# EAGLE design mbc_91_24_04_01 (EAGLE 7.6.0)

## Sheet 1 of 2
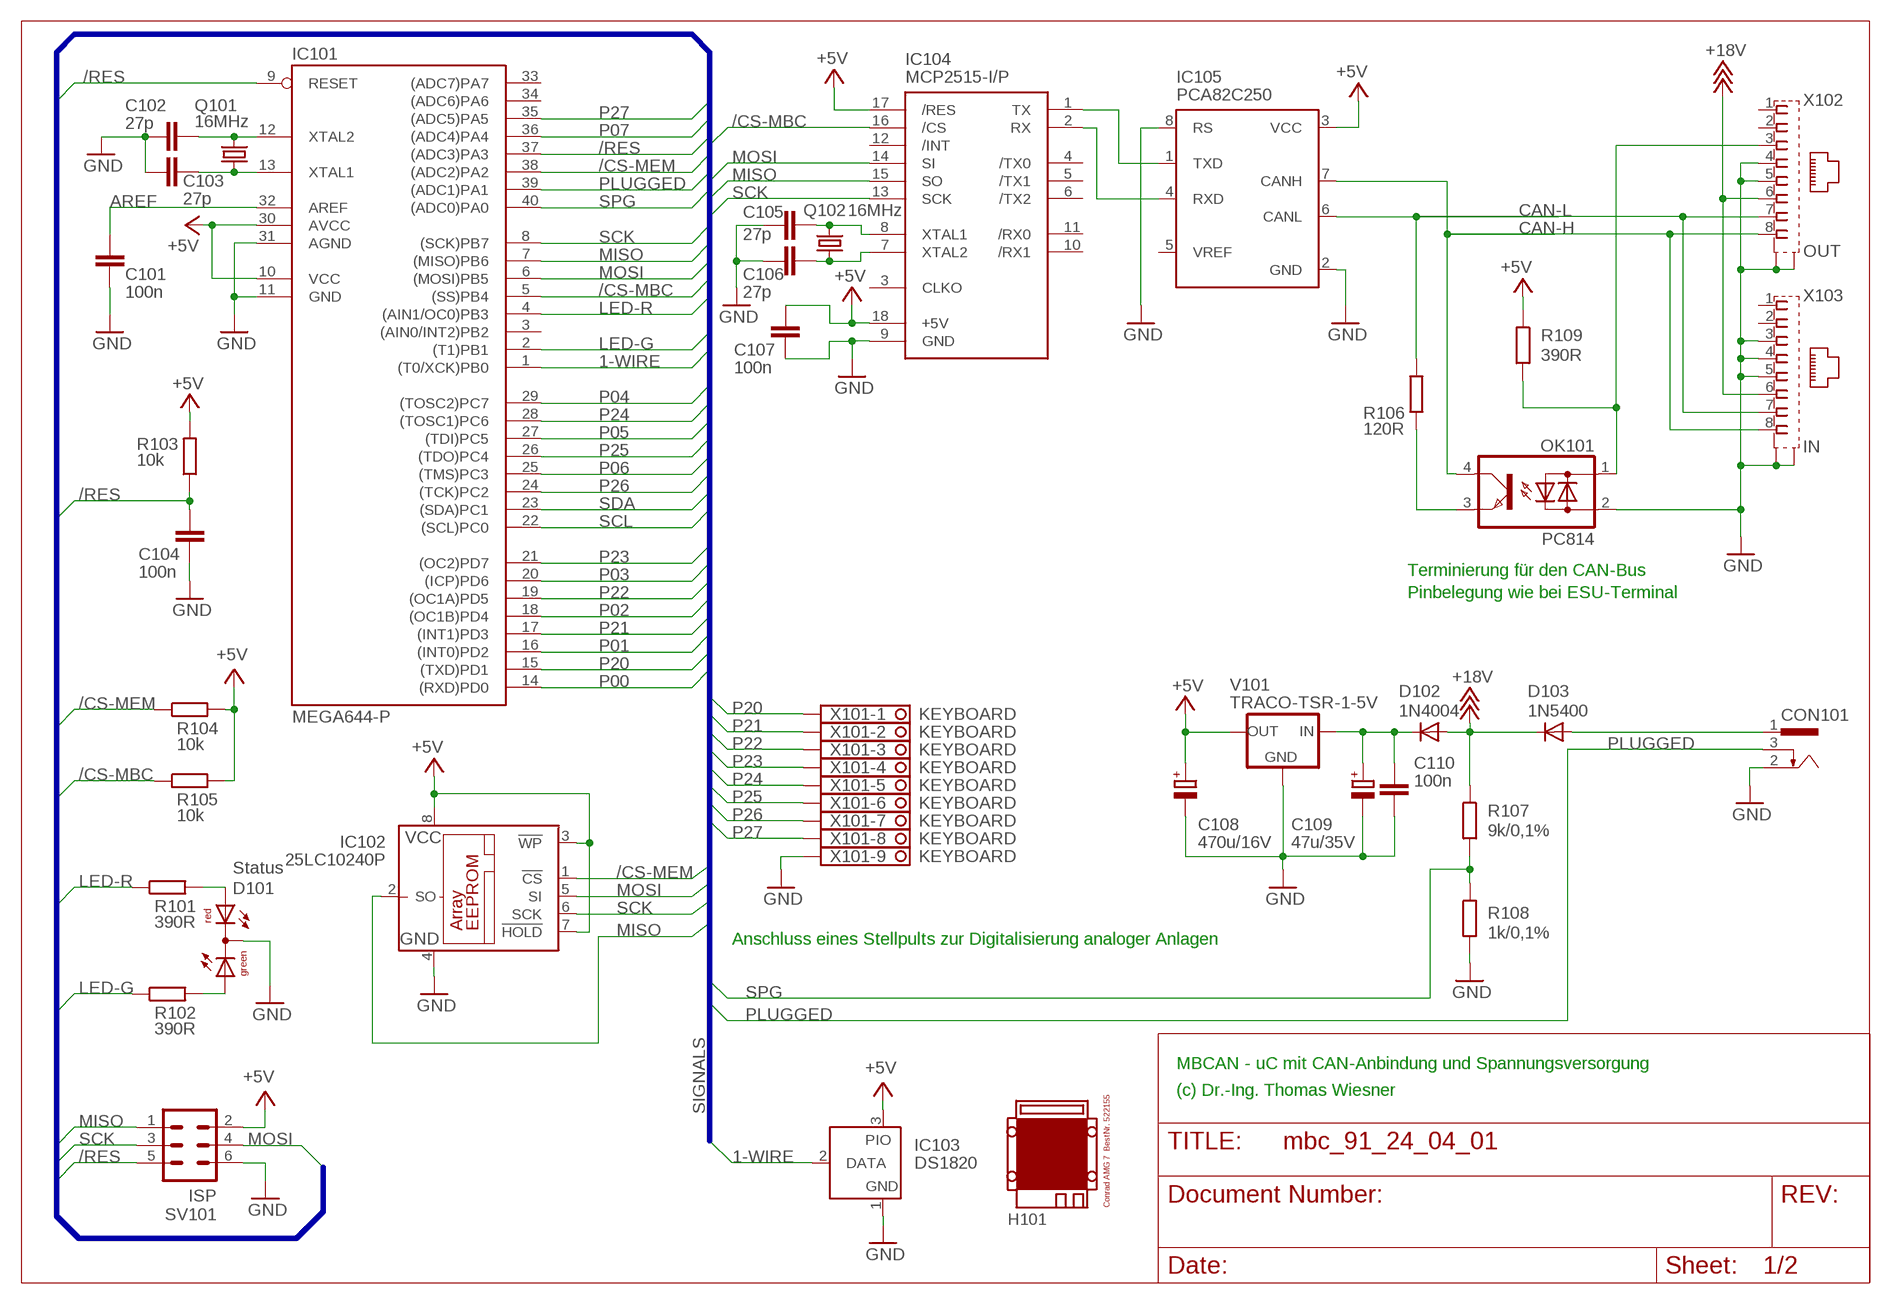
[diagram p0: schematic, sheet 1]

### Parts
C101  100n  C-EU025-025X050  [C025-025X050]
C102  27p  C-EU025-025X050  [C025-025X050]
C103  27p  C-EU025-025X050  [C025-025X050]
C104  100n  C-EU025-025X050  [C025-025X050]
C105  27p  C-EU025-025X050  [C025-025X050]
C106  27p  C-EU025-025X050  [C025-025X050]
C107  100n  C-EU025-025X050  [C025-025X050]
C108  470u/16V  CPOL-EUE3.5-8  [E3,5-8]
C109  47u/35V  CPOL-EUE2.5-7  [E2,5-7]
C110  100n  C-EU025-025X050  [C025-025X050]
CON101  POWER-JACK  [POWER-JACK]
D101  Status  DUOLED5MM  [DUOLED5MM]
D102  1N4004  [DO41-10]
D103  1N5400  [DO201-15]
H101  MODULGEHÄUSE-AMG-7  [MODULGEHÄUSE-AMG-7]
IC101  MEGA644-P  MEGA323-P  [DIL40]
IC102  25LC10240P  25LC040P  [DIL8]
IC103  DS1820  DS2405  [TO92-]
IC104  MCP2515-I/P  MCP2510-I/P  [DIL18]
IC105  PCA82C250  [DIL08]
OK101  PC814  [DIL04]
Q101  16MHz  CRYSTALHC49U70  [HC49U70]
Q102  16MHz  CRYSTALHC49U70  [HC49U70]
R101  390R  R-EU_0207/10  [0207/10]
R102  390R  R-EU_0207/10  [0207/10]
R103  10k  R-EU_0207/10  [0207/10]
R104  10k  R-EU_0207/10  [0207/10]
R105  10k  R-EU_0207/10  [0207/10]
R106  120R  R-EU_0207/10  [0207/10]
R107  9k/0,1%  R-EU_0207/10  [0207/10]
R108  1k/0,1%  R-EU_0207/10  [0207/10]
R109  390R  R-EU_0207/10  [0207/10]
SV101  ISP  ML6  [ML6]
V101  TRACO-TSR-1-5V  [TRACO-TSR-1]
X101  KEYBOARD  1751316  [1751316]
X102  OUT  0446200002  [0446200002]
X103  IN  0446200002  [0446200002]

### Nets
1-WIRE: IC101.1((T0/XCK)PB0) IC103.2(DATA)
+5V: C107.1 C108.+ IC101.10(VCC) IC101.30(AVCC) IC102.3(!WP) IC102.7(!HOLD) IC102.8(VCC) IC103.3(PIO) IC104.17(/RES) IC104.18(+5V) IC105.3(VCC) R103.2 R104.2 R105.2 R109.1 SV101.2 V101.OUT ; also sheet 2
+18V: D102.A D103.C R107.1 X102.6 X103.6 ; also sheet 2
/CS-MBC: IC101.5((SS)PB4) IC104.16(/CS) R105.1
/CS-MEM: IC101.38((ADC2)PA2) IC102.1(!CS) R104.1
/RES: C104.1 IC101.9(RESET) IC101.37((ADC3)PA3) R103.1 SV101.5
AREF: C101.1 IC101.32(AREF)
CAN-H: IC105.7(CANH) OK101.4(C) X102.8 X103.8
CAN-L: IC105.6(CANL) R106.2 X102.7 X103.7
GND: C101.2 C102.1 C103.1 C104.2 C105.1 C106.1 C107.2 C108.- C109.- C110.2 CON101.2 D101.K(C) IC101.11(GND) IC101.31(AGND) IC102.4(GND) IC103.1(GND) IC104.9(GND) IC105.2(GND) IC105.8(RS) OK101.2(AC2) R108.2 SV101.6 V101.GND X101.9 X102.4 X102.5 X102.S@1(S1) X102.S@2(S2) X103.3 X103.4 X103.5 X103.S@1(S1) X103.S@2(S2) ; also sheet 2
LED-G: IC101.2((T1)PB1) R102.1
LED-R: IC101.4((AIN1/OC0)PB3) R101.1
MISO: IC101.7((MISO)PB6) IC102.2(SO) IC104.15(SO) SV101.1
MOSI: IC101.6((MOSI)PB5) IC102.5(SI) IC104.14(SI) SV101.4
N$1: IC104.1(TX) IC105.1(TXD)
N$2: IC104.2(RX) IC105.4(RXD)
N$3: OK101.3(E) R106.1
N$4: OK101.1(AC1) R109.2 X102.3
N$6: C109.+ C110.1 D102.C V101.IN
N$9: D101.AR R101.2
N$13: D101.AG R102.2
N$21: C102.2 IC101.12(XTAL2) Q101.2
N$22: C103.2 IC101.13(XTAL1) Q101.1
N$23: C105.2 IC104.8(XTAL1) Q102.2
N$24: C106.2 IC104.7(XTAL2) Q102.1
P00: IC101.14((RXD)PD0) ; also sheet 2
P01: IC101.16((INT0)PD2) ; also sheet 2
P02: IC101.18((OC1B)PD4) ; also sheet 2
P03: IC101.20((ICP)PD6) ; also sheet 2
P04: IC101.29((TOSC2)PC7) ; also sheet 2
P05: IC101.27((TDI)PC5) ; also sheet 2
P06: IC101.25((TMS)PC3) ; also sheet 2
P07: IC101.36((ADC4)PA4) ; also sheet 2
P20: IC101.15((TXD)PD1) X101.1
P21: IC101.17((INT1)PD3) X101.2
P22: IC101.19((OC1A)PD5) X101.3
P23: IC101.21((OC2)PD7) X101.4
P24: IC101.28((TOSC1)PC6) X101.5
P25: IC101.26((TDO)PC4) X101.6
P26: IC101.24((TCK)PC2) X101.7
P27: IC101.35((ADC5)PA5) X101.8
PLUGGED: CON101.3 IC101.39((ADC1)PA1)
SCK: IC101.8((SCK)PB7) IC102.6(SCK) IC104.13(SCK) SV101.3
SCL: IC101.22((SCL)PC0) ; also sheet 2
SDA: IC101.23((SDA)PC1) ; also sheet 2
SPG: IC101.40((ADC0)PA0) R107.2 R108.1
V-NETZTEIL: CON101.1 D103.A
Unconnected: IC101.3((AIN0/INT2)PB2) IC101.33((ADC7)PA7) IC101.34((ADC6)PA6) IC104.3(CLKO) IC104.4(/TX0) IC104.5(/TX1) IC104.6(/TX2) IC104.10(/RX1) IC104.11(/RX0) IC104.12(/INT) IC105.5(VREF) X102.1 X102.2 X103.1 X103.2

### Buses
SIGNALS

### Notes on the sheet
- Terminierung für den CAN-Bus
- Pinbelegung wie bei ESU-Terminal
- Anschluss eines Stellpults zur Digitalisierung analoger Anlagen
- MBCAN - uC mit CAN-Anbindung und Spannungsversorgung
- (c) Dr.-Ing. Thomas Wiesner

## Sheet 2 of 2
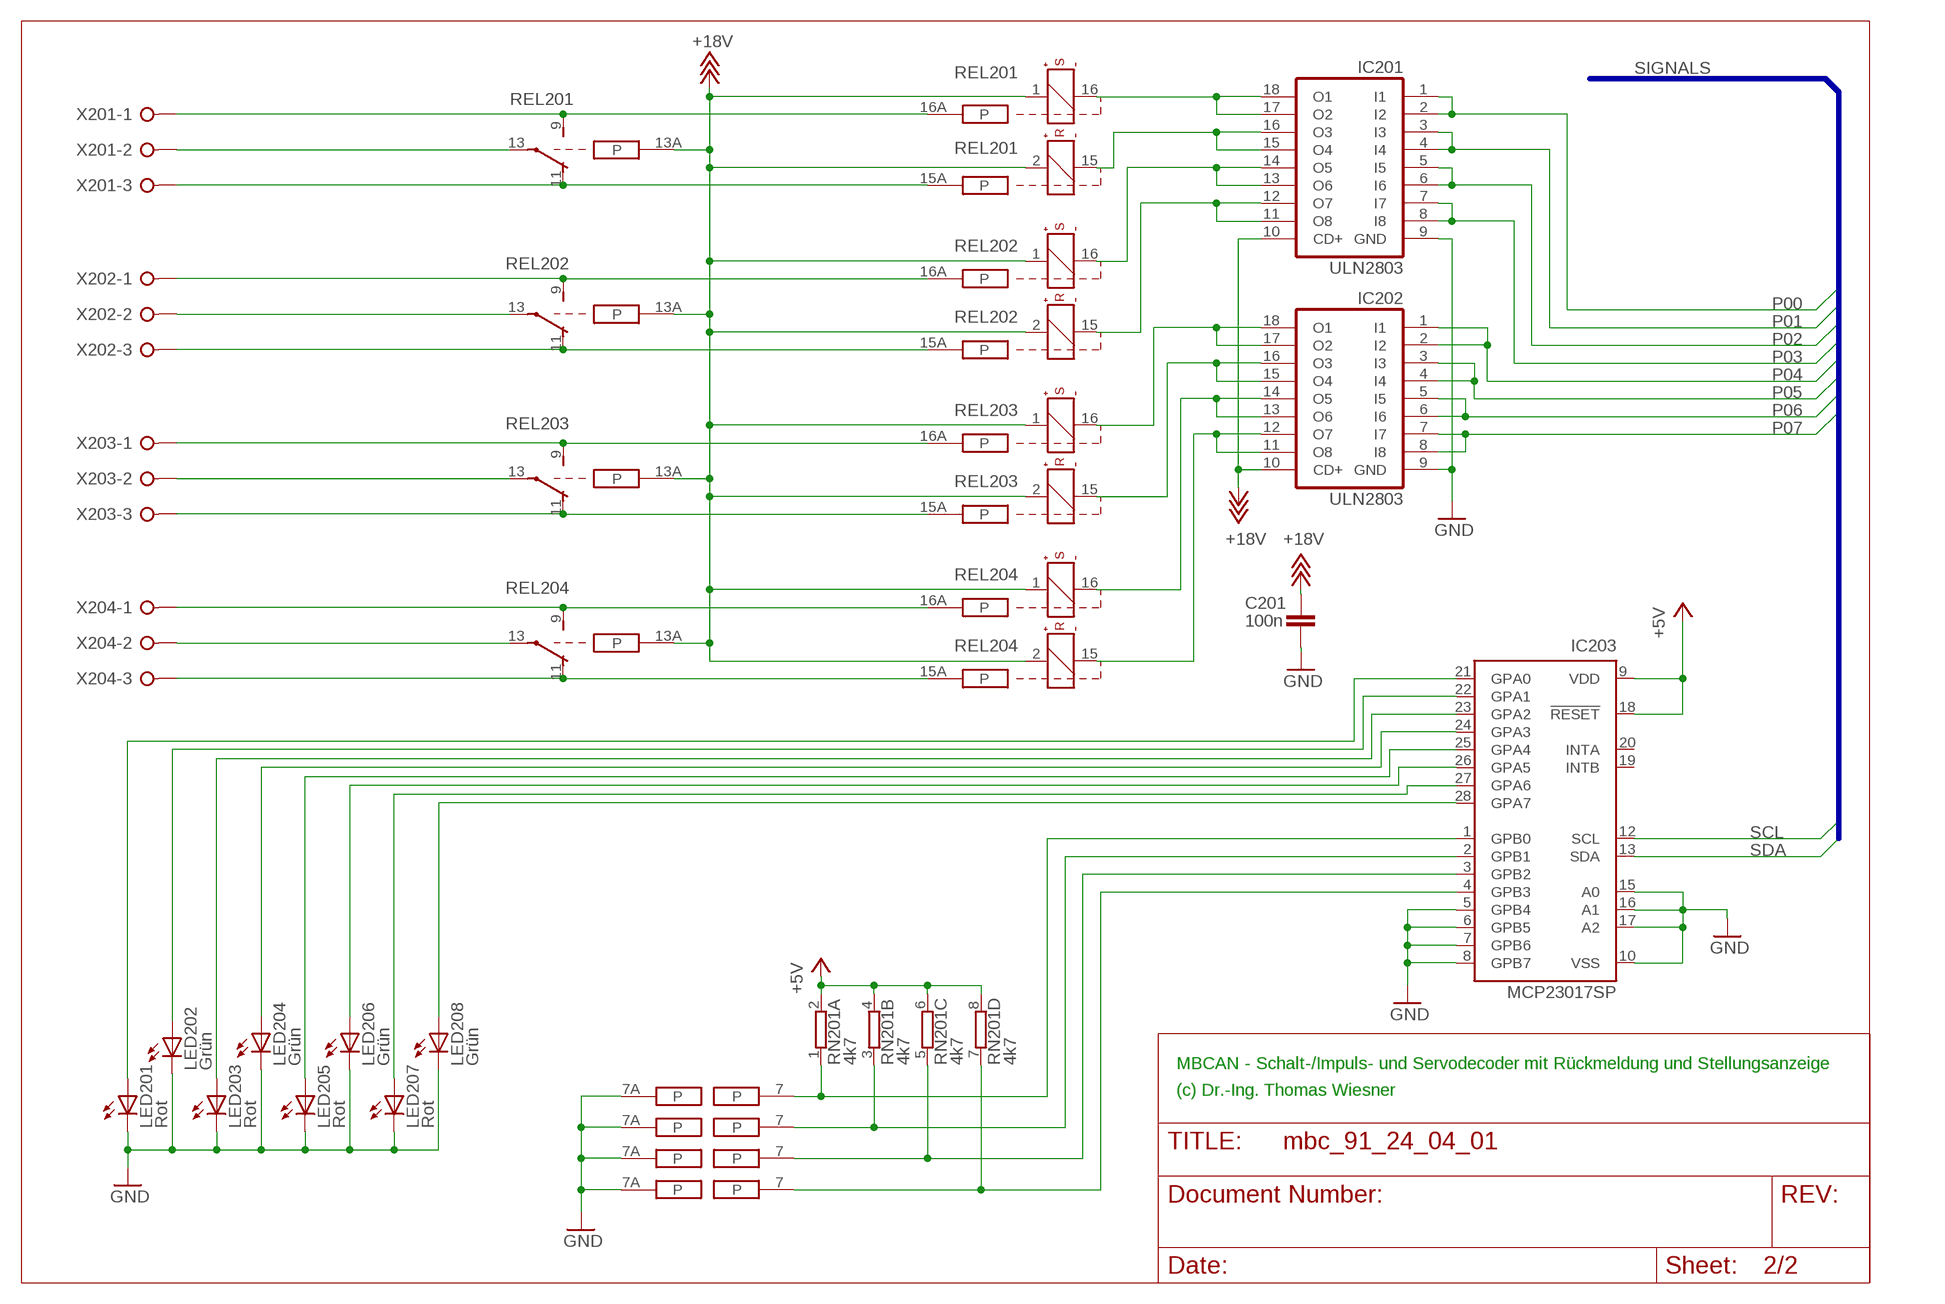
[diagram p1: schematic, sheet 2]

### Parts
C201  100n  C-EU025-025X050  [C025-025X050]
IC201  ULN2803  ULN2803A  [DIL18]
IC202  ULN2803  ULN2803A  [DIL18]
IC203  MCP23017SP  [DIL28-3]
LED201  Rot  LED3MM  [LED3MM]
LED202  Grün  LED3MM  [LED3MM]
LED203  Rot  LED3MM  [LED3MM]
LED204  Grün  LED3MM  [LED3MM]
LED205  Rot  LED3MM  [LED3MM]
LED206  Grün  LED3MM  [LED3MM]
LED207  Rot  LED3MM  [LED3MM]
LED208  Grün  LED3MM  [LED3MM]
REL201  RELAIS+PADS  [REL-BIPOLAR-LOETPADS]
REL202  RELAIS+PADS  [REL-BIPOLAR-LOETPADS]
REL203  RELAIS+PADS  [REL-BIPOLAR-LOETPADS]
REL204  RELAIS+PADS  [REL-BIPOLAR-LOETPADS]
RN201  4k7  E4R  [SIL8]
X201  W237-03P  [W237-133]
X202  W237-03P  [W237-133]
X203  W237-03P  [W237-133]
X204  W237-03P  [W237-133]

### Nets
+5V: IC203.9(VDD) IC203.18(!RESET) RN201.2 RN201.4 RN201.6 RN201.8 ; also sheet 1
+18V: C201.1 IC201.10(CD+) IC202.10(CD+) REL201.1(+) REL201.2(+) REL201.13A(P) REL202.1(+) REL202.2(+) REL202.13A(P) REL203.1(+) REL203.2(+) REL203.13A(P) REL204.1(+) REL204.2(+) REL204.13A(P) ; also sheet 1
GND: C201.2 IC201.9(GND) IC202.9(GND) IC203.5(GPB4) IC203.6(GPB5) IC203.7(GPB6) IC203.8(GPB7) IC203.10(VSS) IC203.15(A0) IC203.16(A1) IC203.17(A2) LED201.K(C) LED202.K(C) LED203.K(C) LED204.K(C) LED205.K(C) LED206.K(C) LED207.K(C) LED208.K(C) REL201.7A(P) REL202.7A(P) REL203.7A(P) REL204.7A(P) ; also sheet 1
K11: REL201.9(S) REL201.16A(P) X201.1
K12: REL201.13(P) X201.2
K13: REL201.11(O) REL201.15A(P) X201.3
K21: REL202.9(S) REL202.16A(P) X202.1
K22: REL202.13(P) X202.2
K23: REL202.11(O) REL202.15A(P) X202.3
K31: REL203.9(S) REL203.16A(P) X203.1
K32: REL203.13(P) X203.2
K33: REL203.11(O) REL203.15A(P) X203.3
K41: REL204.9(S) REL204.16A(P) X204.1
K42: REL204.13(P) X204.2
K43: REL204.11(O) REL204.15A(P) X204.3
N$5: IC203.22(GPA1) LED202.A
N$7: IC203.21(GPA0) LED201.A
N$8: IC201.15(O4) IC201.16(O3) REL201.15(-)
N$10: IC203.23(GPA2) LED203.A
N$11: IC203.25(GPA4) LED205.A
N$12: IC203.27(GPA6) LED207.A
N$14: IC203.1(GPB0) REL201.7(P) RN201.1
N$15: IC203.2(GPB1) REL202.7(P) RN201.3
N$16: IC203.3(GPB2) REL203.7(P) RN201.5
N$17: IC203.4(GPB3) REL204.7(P) RN201.7
N$18: IC203.24(GPA3) LED204.A
N$19: IC203.26(GPA5) LED206.A
N$20: IC203.28(GPA7) LED208.A
N$37: IC201.11(O8) IC201.12(O7) REL202.15(-)
N$50: IC202.15(O4) IC202.16(O3) REL203.15(-)
N$52: IC202.11(O8) IC202.12(O7) REL204.15(-)
P00: IC201.1(I1) IC201.2(I2) ; also sheet 1
P01: IC201.3(I3) IC201.4(I4) ; also sheet 1
P02: IC201.5(I5) IC201.6(I6) ; also sheet 1
P03: IC201.7(I7) IC201.8(I8) ; also sheet 1
P04: IC202.1(I1) IC202.2(I2) ; also sheet 1
P05: IC202.3(I3) IC202.4(I4) ; also sheet 1
P06: IC202.5(I5) IC202.6(I6) ; also sheet 1
P07: IC202.7(I7) IC202.8(I8) ; also sheet 1
S1: IC201.17(O2) IC201.18(O1) REL201.16(-)
S2: IC201.13(O6) IC201.14(O5) REL202.16(-)
S3: IC202.17(O2) IC202.18(O1) REL203.16(-)
S4: IC202.13(O6) IC202.14(O5) REL204.16(-)
SCL: IC203.12(SCL) ; also sheet 1
SDA: IC203.13(SDA) ; also sheet 1
Unconnected: IC203.19(INTB) IC203.20(INTA) REL201.4(P) REL201.6(O) REL201.8(S) REL202.4(P) REL202.6(O) REL202.8(S) REL203.4(P) REL203.6(O) REL203.8(S) REL204.4(P) REL204.6(O) REL204.8(S)

### Buses
SIGNALS

### Notes on the sheet
- MBCAN - Schalt-/Impuls- und Servodecoder mit Rückmeldung und Stellungsanzeige
- (c) Dr.-Ing. Thomas Wiesner

## Library data of the parts
C101-C107 C110 C201 = rcl:C-EU: CAPACITOR, European symbol
C108 C109 = rcl:CPOL-EU: POLARIZED CAPACITOR, European symbol
CON101 = mbc:POWER-JACK: Power-Stecker für 2,5 mm Hohlbuchse
D101 = led:DUOLED5MM: DUO LED 2 colors, 5 mm, round
D102 = diode:1N4004: DIODE general purpose rectifier, 1 A
D103 = diode:1N5400: DIODE standard rectifier, 3 A, 50 V (Motorola)
H101 = mbc:MODULGEHÄUSE-AMG-7: Gehäuse Conrad AMG 7 BestNr. 522155
IC101 = atmel:MEGA323-P: MICROCONTROLLER 32 Kbytes FLASH 2 Kbytes SRAM 1 Kbytes EEPROM USART 8-channel 10 bit ADC Source: avr.lbr; OC_FARNELL: unknown; OC_NEWARK: unknown
IC102 = microchip:25*: Serial EEPROM 4K/ 8K , SPI bus; MF: MICROCHIP; MPN: 25LC040/P; OC_FARNELL: 9758100; OC_NEWARK: 96K4091
IC103 = maxim:DS2405: Addressable Switch DALLAS Semiconductor; MF: DALLAS SEMICONDUCTOR; MPN: DS2405; OC_FARNELL: 1188025; OC_NEWARK: 06F4645
IC104 = mbc:MCP2510: BASIC-CAN 2.0a Controller Stand-alone CAN controller von Microchip
IC105 = micro-philips:PCA82C250: CAN CONTROLLER INTERFACE; OC_FARNELL: 3692358; OC_NEWARK: unknown
IC201 IC202 = uln-udn:ULN2803A: DRIVER ARRAY
IC203 = microchip:MCP23017: http://ww1.microchip.com/downloads/en/DeviceDoc/21952a.pdf Source: http://ww1.microchip.com/downloads/en/DeviceDoc/21952a.pdf; MF: MICROCHIP; MPN: MCP23017-E/SP; OC_FARNELL: 1332088; OC_NEWARK: 31K2959
LED201-LED208 = led:LED: LED OSRAM: - CHIPLED LG R971, LG N971, LY N971, LG Q971, LY Q971, LO R971, LY R971 LH N974, LH R974 LS Q976, LO Q976, LY Q976 LO Q996 - Hyper CHIPLED LW Q18S LB Q993, LB Q99A, LB R99A - SideLED LS A670, LO A670, LY A670, LG A670, LP A670 LB A673, LV A673, LT A673, LW A673 LH A674 LY A675 LS A676, LA A676, LO A676, LY A676, LW A676 LS A679, LY A679, LG A679 - Hyper Micro SIDELED® LS Y876, LA Y876, LO Y876, LY Y876 LT Y87S - SmartLED LW L88C, LW L88S LB L89C, LB L89S, LG L890 LS L89K, LO L89K, LY L89K LS L896, LA L896, LO L896, LY L896 - TOPLED LS T670, LO T670, LY T670, LG T670, LP T670 LSG T670, LSP T670, LSY T670, LOP T670, LYG T670 LG T671, LOG T671, LSG T671 LB T673, LV T673, LT T673, LW T673 LH T674 LS T676, LA T676, LO T676, LY T676, LB T676, LH T676, LSB T676, LW T676 LB T67C, LV T67C, LT T67C, LS T67K, LO T67K, LY T67K, LW E67C LS E67B, LA E67B, LO E67B, LY E67B, LB E67C, LV E67C, LT E67C LW T67C LS T679, LY T679, LG T679 LS T770, LO T770, LY T770, LG T770, LP T770 LB T773, LV T773, LT T773, LW T773 LH T774 LS E675, LA E675, LY E675, LS T675 LS T776, LA T776, LO T776, LY T776, LB T776 LHGB T686 LT T68C, LB T68C - Hyper Mini TOPLED® LB M676 - Mini TOPLED Santana® LG M470 LS M47K, LO M47K, LY M47K Source: http://www.osram.convergy.de LUXEON: - LUMILED® LXK2-PW12-R00, LXK2-PW12-S00, LXK2-PW14-U00, LXK2-PW14-V00 LXK2-PM12-R00, LXK2-PM12-S00, LXK2-PM14-U00 LXK2-PE12-Q00, LXK2-PE12-R00, LXK2-PE12-S00, LXK2-PE14-T00, LXK2-PE14-U00 LXK2-PB12-K00, LXK2-PB12-L00, LXK2-PB12-M00, LXK2-PB14-N00, LXK2-PB14-P00, LXK2-PB14-Q00 LXK2-PR12-L00, LXK2-PR12-M00, LXK2-PR14-Q00, LXK2-PR14-R00 LXK2-PD12-Q00, LXK2-PD12-R00, LXK2-PD12-S00 LXK2-PH12-R00, LXK2-PH12-S00 LXK2-PL12-P00, LXK2-PL12-Q00, LXK2-PL12-R00 Source: www.luxeon.com KINGBRIGHT: KA-3528ASYC Source: www.kingbright.com
OK101 = optocoupler:PC814: SHARP OPTO COUPLER; OC_FARNELL: 9707662; OC_NEWARK: unknown
Q101 Q102 = crystal:CRYSTAL: CRYSTAL; OC_FARNELL: unknown; OC_NEWARK: unknown
R101-R109 = resistor:R-EU_: RESISTOR, European symbol
REL201-REL204 = mbc:RELAIS+PADS: Bistabiles Relais 2xUM 12V mit Lötbrücken
RN201 = resistor-sil:E4R: SIL RESISTOR; OC_FARNELL: unknown; OC_NEWARK: unknown
SV101 = con-ml:ML6: HARTING; OC_FARNELL: unknown; OC_NEWARK: unknown
V101 = mbc:TRACO-TSR-1-5V: Spannungsregler Hersteller: TRACO Typ: TSR-1 5V: TSR 1-2450 Spg: 5V Strom: 1A Reichelt TSR 1-2450
X101 = con-phoenix-350:1751316: MKDS 1/ 9-3,5 Printklemme Nennstrom: 10 A Bemessungsspannung: 160 V Raster: 3,5 mm Polzahl: 9 Montageart: Löten Anschlussart: Schraubanschluss Anschlussrichtung vom Leiter zur Platine: 0° Source: http://eshop.phoenixcontact.com .. 1751316.pdf; OC_FARNELL: unknown; OC_NEWARK: unknown
X102 X103 = mbc:0446200002: RJ-45 INVERTED MODULAR JACK ASSEMBLY WITH RJ-11 KEEPOUT FEATURE Source: Data sheet <http://www.farnell.com/datasheets/73207.pdf> MOLEX 0446200002 BUCHSE, RJ45, GESCHIRMT Source: Farnell <http://de.farnell.com/molex/0446200002/buchse-rj45-geschirmt/dp/9251910?ost=9251910>; MF: MOLEX; MPN: 0446200002; OC_FARNELL: 9251910
X201-X204 = con-wago-508:W237-03P: WAGO SREW CLAMP; OC_FARNELL: unknown; OC_NEWARK: unknown

## Board
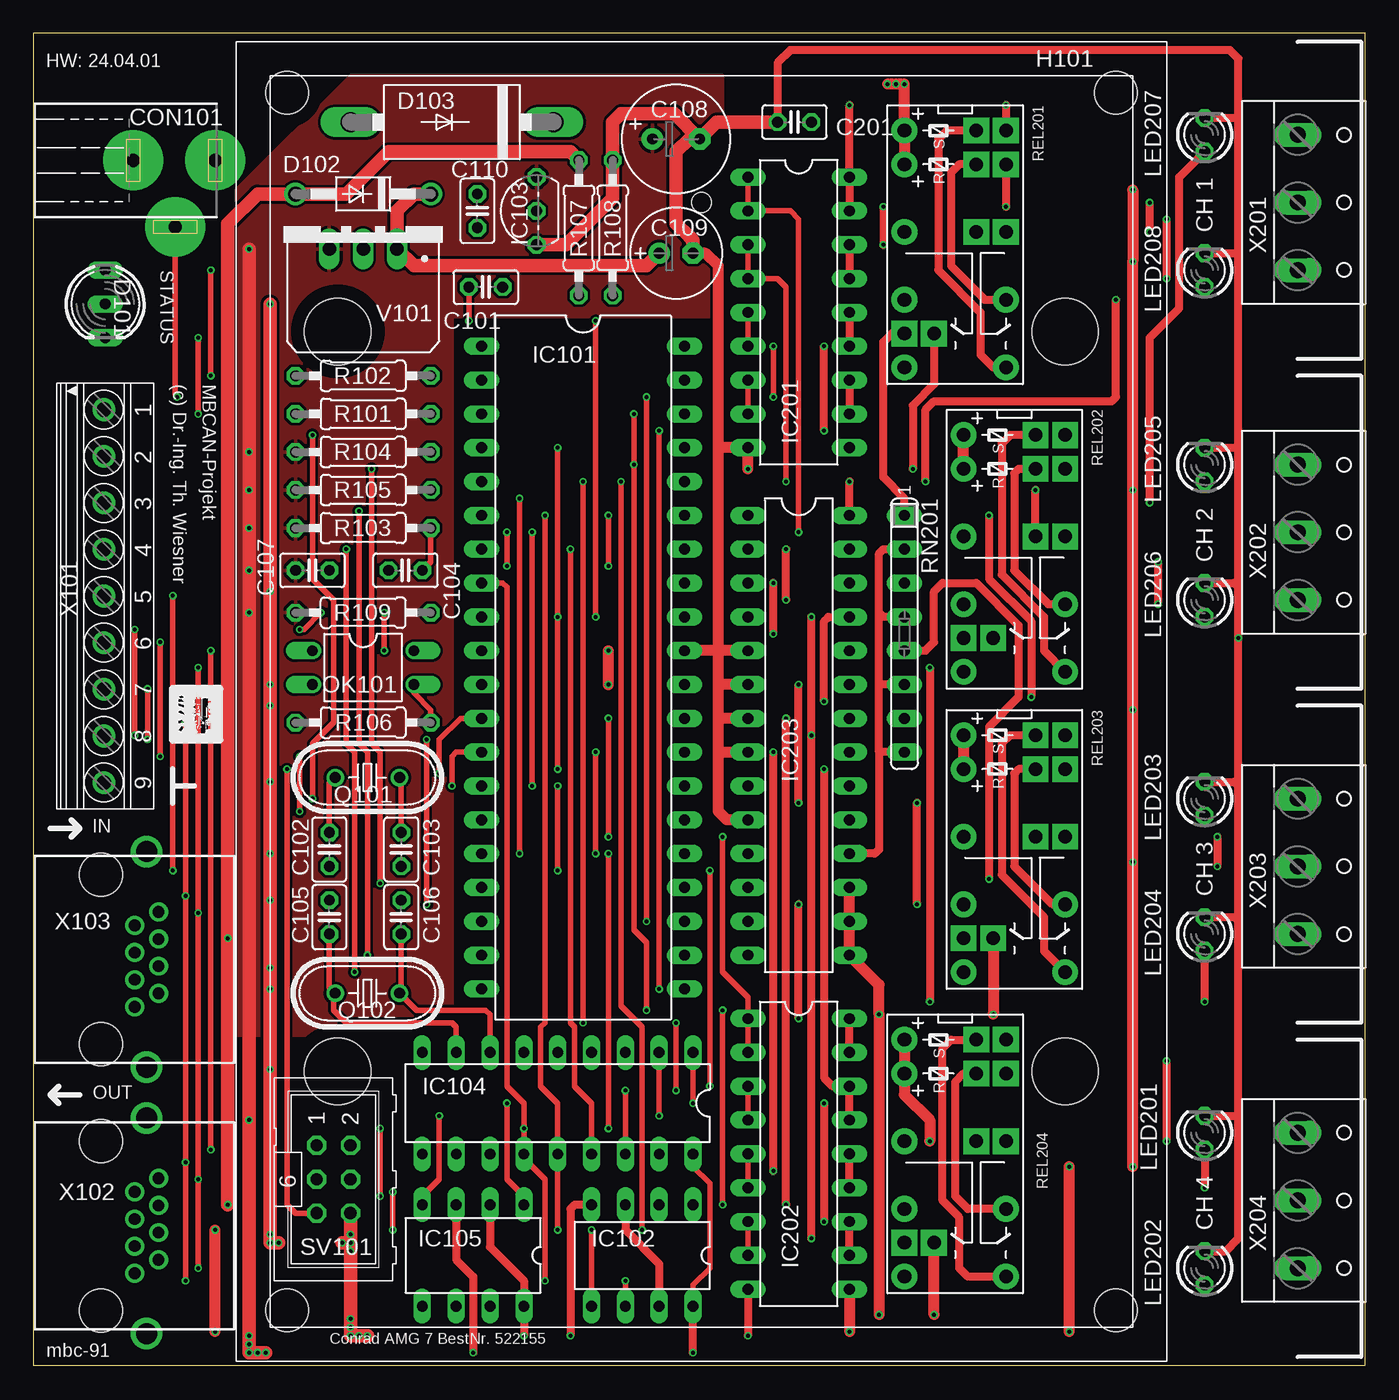
[diagram p2: board, top side]
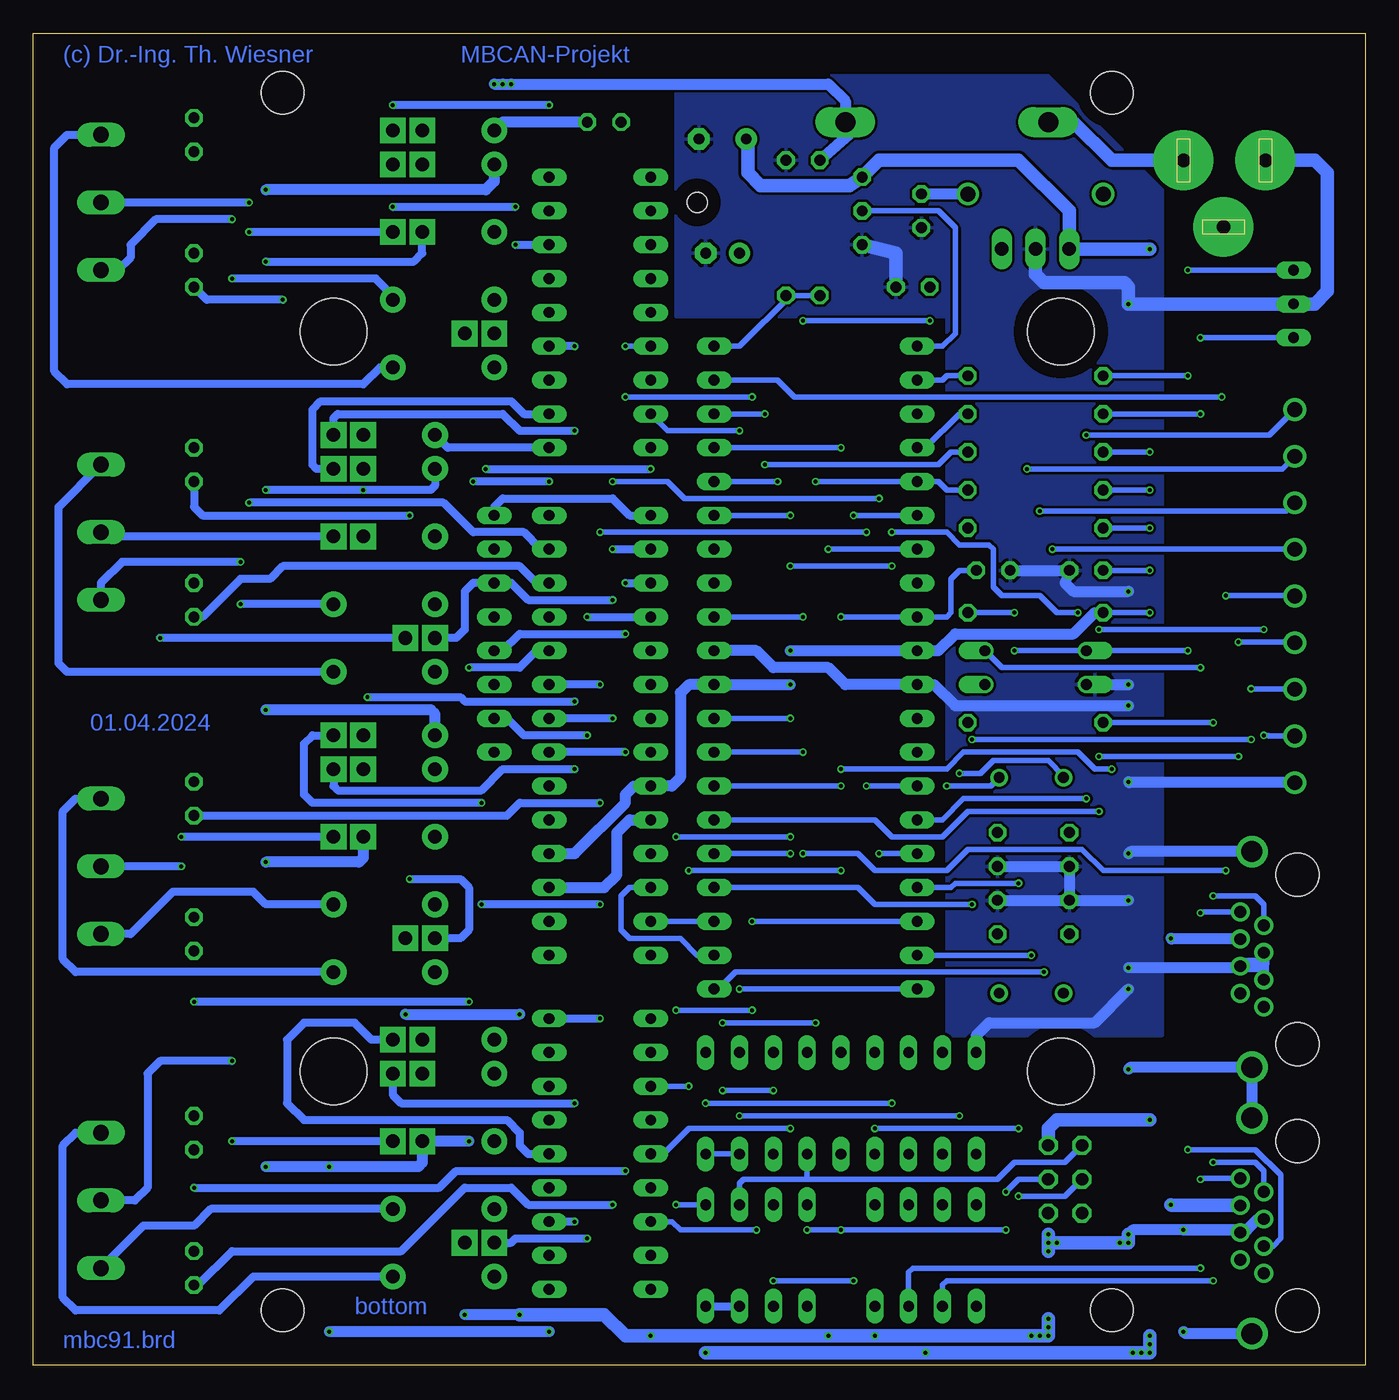
[diagram p3: board, bottom side, seen from below]

Size 100.01 x 100.01 mm. Coordinates in mm from the lower left corner, seen from the top.
Outline: 100,0.02 0,0.02 0,100.01 100,100.01
Outline: 100.01,0 100.01,100.01
Copper layers (1*16): Top 0.035mm / dielectric 1.5mm / Bottom 0.035mm
Design rules "default *": minimum track width 10mil, minimum drill 0.3mm, track to track 8mil, track to pad 8mil, pad to pad 8mil, via to via 8mil, smd to smd 8mil, copper to edge 40mil, drill to drill 8mil, minimum pad ring 10mil, minimum via ring 0.125mm, stop-mask expansion 4mil, vias tented up to drill 0mil, thermal gap 10mil

### Footprints (pad centres in the part's own frame; a part is rotated, then mirrored left to right if it is on the bottom)
C025-025X050 = drill 0.813 octagon: 1 -1.27,0; 2 1.27,0
E3,5-8 = drill 0.813 pad 1.6: + -1.778,0 | drill 0.813 pad 1.6 octagon: - 1.778,0
E2,5-7 = drill 0.813 pad 1.6: + -1.27,0 | drill 0.813 pad 1.6 octagon: - 1.27,0
POWER-JACK = drill 1 pad 4.5: 1 0,6.03; 2 0,-0.12; 3 5,3.03
DUOLED5MM = drill 0.813 long: AG -2.54,0; AR 2.54,0; K 0,0
DO41-10 = drill 1.118: A 5.08,0; C -5.08,0
DO201-15 = drill 1.499 long: A 7.62,0; C -7.62,0
MODULGEHÄUSE-AMG-7 = hole 3.2: -45.72,-31.115; -45.72,31.115; 45.72,31.115; 45.72,-31.115 | hole 5: -27.781,-27.305; 27.781,-27.305; -27.781,27.305; 27.781,27.305 | hole 1.5: -37.465,0
DIL40 = drill 0.813 long: 1 -24.13,-7.62; 2 -21.59,-7.62; 3 -19.05,-7.62; 4 -16.51,-7.62; 5 -13.97,-7.62; 6 -11.43,-7.62; 7 -8.89,-7.62; 8 -6.35,-7.62; 9 -3.81,-7.62; 10 -1.27,-7.62; 11 1.27,-7.62; 12 3.81,-7.62; 13 6.35,-7.62; 14 8.89,-7.62; 15 11.43,-7.62; 16 13.97,-7.62; 17 16.51,-7.62; 18 19.05,-7.62; 19 21.59,-7.62; 20 24.13,-7.62; 21 24.13,7.62; 22 21.59,7.62; 23 19.05,7.62; 24 16.51,7.62; 25 13.97,7.62; 26 11.43,7.62; 27 8.89,7.62; 28 6.35,7.62; 29 3.81,7.62; 30 1.27,7.62; 31 -1.27,7.62; 32 -3.81,7.62; 33 -6.35,7.62; 34 -8.89,7.62; 35 -11.43,7.62; 36 -13.97,7.62; 37 -16.51,7.62; 38 -19.05,7.62; 39 -21.59,7.62; 40 -24.13,7.62
DIL8 = drill 0.813 long: 1 -3.81,-3.81; 2 -1.27,-3.81; 3 1.27,-3.81; 4 3.81,-3.81; 5 3.81,3.81; 6 1.27,3.81; 7 -1.27,3.81; 8 -3.81,3.81
TO92- = drill 0.813 octagon: 1 -2.54,0; 2 0,0; 3 2.54,0
DIL18 = drill 0.813 long: 1 -10.16,-3.81; 2 -7.62,-3.81; 3 -5.08,-3.81; 4 -2.54,-3.81 | drill 0.8 long: 5 0,-3.81; 6 2.54,-3.81; 7 5.08,-3.81; 8 7.62,-3.81; 9 10.16,-3.81; 10 10.16,3.81; 11 7.62,3.81; 12 5.08,3.81; 13 2.54,3.81; 14 0,3.81; 15 -2.54,3.81; 16 -5.08,3.81; 17 -7.62,3.81; 18 -10.16,3.81
DIL08 = drill 0.813 long: 1 -3.81,-3.81; 2 -1.27,-3.81; 3 1.27,-3.81; 4 3.81,-3.81; 5 3.81,3.81; 6 1.27,3.81; 7 -1.27,3.81; 8 -3.81,3.81
DIL18' = drill 0.813 long: 1 -10.16,-3.81; 2 -7.62,-3.81; 3 -5.08,-3.81; 4 -2.54,-3.81; 5 0,-3.81; 6 2.54,-3.81; 7 5.08,-3.81; 8 7.62,-3.81; 9 10.16,-3.81; 10 10.16,3.81; 11 7.62,3.81; 12 5.08,3.81; 13 2.54,3.81; 14 0,3.81; 15 -2.54,3.81; 16 -5.08,3.81; 17 -7.62,3.81; 18 -10.16,3.81
DIL28-3 = drill 0.813 long: 1 -16.51,-3.81; 2 -13.97,-3.81; 3 -11.43,-3.81; 4 -8.89,-3.81; 5 -6.35,-3.81; 6 -3.81,-3.81; 7 -1.27,-3.81; 8 1.27,-3.81; 9 3.81,-3.81; 10 6.35,-3.81; 11 8.89,-3.81; 12 11.43,-3.81; 13 13.97,-3.81; 14 16.51,-3.81; 15 16.51,3.81; 16 13.97,3.81; 17 11.43,3.81; 18 8.89,3.81; 19 6.35,3.81; 20 3.81,3.81; 21 1.27,3.81; 22 -1.27,3.81; 23 -3.81,3.81; 24 -6.35,3.81; 25 -8.89,3.81; 26 -11.43,3.81; 27 -13.97,3.81; 28 -16.51,3.81
LED3MM = drill 0.813 octagon: A -1.27,0; K 1.27,0
DIL04 = drill 0.813 offset: 1 -1.27,-3.81; 2 1.27,-3.81; 3 1.27,3.81; 4 -1.27,3.81
HC49U70 = drill 0.813: 1 -2.413,0; 2 2.413,0
0207/10 = drill 0.813 octagon: 1 -5.08,0; 2 5.08,0
REL-BIPOLAR-LOETPADS = drill 1.016 pad 1.93: 1 -8.89,-3.81; 2 -6.35,-3.81; 4 -1.27,-3.81; 6 3.81,-3.81; 8 8.89,-3.81; 9 8.89,3.81; 11 3.81,3.81 | drill 1.016 pad 1.93 square: 7 6.35,-3.81; 7A 6.35,-1.587; 13 -1.27,3.81; 13A -1.27,1.587; 15 -6.35,3.81; 15A -6.35,1.587; 16 -8.89,3.81; 16A -8.89,1.587
SIL8 = drill 0.813 long: 1 -8.89,0; 2 -6.35,0; 3 -3.81,0; 4 -1.27,0; 5 1.27,0; 6 3.81,0; 7 6.35,0; 8 8.89,0
ML6 = drill 0.914 octagon: 1 -2.54,-1.27; 2 -2.54,1.27; 3 0,-1.27; 4 0,1.27; 5 2.54,-1.27; 6 2.54,1.27
TRACO-TSR-1 = drill 1.016 long: GND 0,2.54; IN -2.54,2.54; OUT 2.54,2.54
1751316 = drill 1.1 pad 1.7: 1 -13.973,-0.1; 2 -10.473,-0.1; 3 -6.973,-0.1; 4 -3.473,-0.1; 5 0.028,-0.1; 6 3.527,-0.1; 7 7.027,-0.1; 8 10.527,-0.1; 9 14.027,-0.1
0446200002 = drill 0.889 pad 1.422: 1 3.556,2.54; 2 2.54,4.318; 3 1.524,2.54; 4 0.508,4.318; 5 -0.508,2.54; 6 -1.524,4.318; 7 -2.54,2.54; 8 -3.556,4.318 | drill 1.575 pad 2.286: S@1 -8.103,3.429; S@2 8.103,3.429 | hole 3.251: 6.35,0; -6.35,0
W237-133 = drill 1.194 long: 1 -5.08,-0.635; 2 0,-0.635; 3 5.08,-0.635

### Placement (x,y rotation side)
C101  33.97,80.96 0 top
C102  22.23,38.73 90 top
C103  27.62,38.73 90 top
C104  27.94,59.69 180 top
C105  22.23,33.66 270 top
C106  27.62,33.66 270 top
C107  20.95,59.69 0 top
C108  48.26,92.08 0 top
C109  48.26,83.5 0 top
C110  33.34,86.68 270 top
C201  57.15,93.34 180 top
CON101  7.62,90.47 270 top
D101  5.4,79.69 270 top
D102  24.77,87.95 180 top
D103  31.43,93.34 180 top
H101  50.16,49.85 270 top
IC101  41.27,52.39 270 top
IC102  45.72,8.26 180 top
IC103  37.78,86.68 90 top
IC104  39.37,19.68 180 top
IC105  33.02,8.26 180 top
IC201  ULN2803  [DIL18']  57.47,79.06 270 top
IC202  ULN2803  [DIL18']  57.47,15.88 270 top
IC203  57.47,47.31 270 top
LED201  87.95,17.46 90 top
LED202  87.95,7.3 90 top
LED203  87.95,42.55 90 top
LED204  87.95,32.38 90 top
LED205  87.95,67.63 90 top
LED206  87.95,57.47 90 top
LED207  87.95,92.39 90 top
LED208  87.95,82.23 90 top
OK101  24.77,52.39 270 top
Q101  25.08,44.13 180 top
Q102  25.08,27.94 180 top
R101  24.77,71.44 180 top
R102  24.77,74.3 180 top
R103  24.77,62.87 180 top
R104  24.77,68.58 180 top
R105  24.77,65.72 180 top
R106  24.77,48.26 180 top
R107  40.96,85.41 270 top
R108  43.5,85.41 90 top
R109  24.77,56.52 0 top
REL201  69.22,83.82 270 top
REL202  73.66,60.96 270 top
REL203  73.66,38.42 270 top
REL204  69.22,15.56 270 top
RN201  65.41,54.93 270 top
SV101  22.54,13.97 270 top
V101  24.77,86.36 180 top
X101  5.4,57.78 270 top
X102  5.08,10.48 270 top
X103  5.08,30.48 270 top
X201  95.57,87.31 270 top
X202  95.57,62.55 270 top
X203  95.57,37.47 270 top
X204  95.57,12.38 270 top

### Tracks (layer width: path | path; a pad name or v marks a point on that pad's centre or on a via)
1-WIRE
  Bottom 0.406: IC103.2 32.07,86.68 30.8,85.41 30.8,77.47 31.75,76.52 IC101.1
+5V  (via drill 0.3)
  Top 0.406: IC104.18 49.53,14.92 50.8,13.65 50.8,7.3 49.53,6.03 IC102.8
  Top 0.61: RN201.8 63.5,46.04 | 63.5,46.04 63.5,51.12 | 63.5,51.12 63.5,56.52 | 63.5,56.52 63.5,60.96 63.82,61.28 RN201.2 | RN201.4 63.82,56.2 63.5,56.52 | RN201.6 63.5,51.12 | 63.5,46.04 63.5,38.73 63.18,38.42 IC203.18 | v49.53,0.95 IC102.8 | IC105.3 31.75,7.94 33.02,6.67 v33.02,0.95 | IC102.3 44.45,10.16 46.99,7.62 IC102.7
  Top 0.813: v43.18,51.12 v43.18,53.66
  Top 1.016: v16.19,83.82 v16.19,68.58 v16.19,65.72 v16.19,62.87 v16.19,59.69 v16.19,56.52 v16.19,18.41 v16.19,2.22 v16.19,1.59 v16.19,0.95 v16.83,0.95 v17.46,0.95
  Bottom 0.406: R104.2 v16.19,68.58 | R105.2 v16.19,65.72 | R103.2 v16.19,62.87 | C107.1 v16.19,59.69 | R109.1 v16.19,56.52 | IC104.17 IC104.18
  Bottom 0.61: IC102.8 IC102.7
  Bottom 0.813: IC203.18 59.37,38.42 55.56,42.23 55.56,42.86 54.93,43.5 IC203.9 52.07,43.5 51.44,44.13 51.44,50.48 50.8,51.12 IC101.30 v43.18,51.12 | v43.18,53.66 IC101.10 32.07,53.66 30.8,54.93 21.91,54.93 20.32,56.52 R109.1
  Bottom 1.016: v16.19,83.82 V101.OUT 22.23,86.68 26.04,90.49 36.51,90.49 IC103.3 38.73,88.58 45.4,88.58 46.35,89.53 46.35,91.95 C108.+ | v49.53,0.95 v33.02,0.95 v17.46,0.95 v16.83,0.95 v16.19,0.95 v16.19,1.59 v16.19,2.22 | SV101.2 23.81,17.78 23.18,18.41 v16.19,18.41
  pour Top: 15.24,24.77 15.24,88.27 23.81,96.84 51.75,96.84 51.75,78.74 31.43,78.74 31.43,24.77
+18V  (via drill 0.3)
  Top 0.61: REL202.13A v75.25,65.72
  Top 0.813: REL201.2 REL201.1 v65.41,96.2 v64.77,96.2 v64.14,96.2 | REL202.2 REL202.1 | REL203.1 REL203.2 | REL204.1 REL204.2 65.41,20.32 67.31,18.41 v67.31,16.83 | v82.55,14.92 v82.55,37.78 v82.55,49.21 v82.55,65.72 v82.55,82.87 v82.55,88.27 | IC202.10 v61.28,2.54 | v77.79,2.54 v77.79,14.92
  Top 1.016: v14.61,12.06 v14.61,32.07 14.61,85.72 16.83,87.95 D102.A 23.5,87.95 26.67,91.12 40.32,91.12 R107.1
  Bottom 0.61: v82.55,82.87 71.44,82.87 70.8,83.5 REL201.13A | REL202.2 69.85,66.04 70.17,65.72 v75.25,65.72 v82.55,65.72 | IC201.10 68.9,68.9 REL202.1
  Bottom 0.813: v82.55,14.92 v77.79,14.92 71.12,14.92 70.8,15.24 REL204.13A v67.31,16.83 | REL201.2 65.41,88.9 66.04,88.27 v82.55,88.27 | REL203.1 69.85,48.9 70.17,49.21 v82.55,49.21 | REL203.13A 75.25,38.1 75.56,37.78 v82.55,37.78 | v61.28,2.54 v77.79,2.54 | X103.6 14.54,32 v14.61,32.07 | v65.41,96.2 v64.77,96.2 v64.14,96.2 40.32,96.2 39.05,94.93 D103.C 38.42,92.71 R107.1 | C201.1 64.77,93.34 REL201.1
  Bottom 1.016: X102.6 14.54,12 v14.61,12.06
/CS-MBC  (via drill 0.3)
  Top 0.406: IC104.16 v44.45,20.64 | v48.26,20.64 v48.26,25.72 | v41.27,25.72 v41.27,66.36
  Bottom 0.406: v44.45,20.64 v48.26,20.64 | v48.26,25.72 v41.27,25.72 | v41.27,66.36 IC101.5 32.07,66.36 31.43,65.72 R105.1
/CS-MEM  (via drill 0.3)
  Top 0.406: v45.09,71.44 v45.09,67.63 45.09,32.7 46.04,31.75 v46.04,26.67 | v51.75,26.67 v51.75,12.06
  Bottom 0.406: R104.1 31.11,68.58 32.07,67.63 v45.09,67.63 | v45.09,71.44 IC101.38 | v46.04,26.67 v51.75,26.67 | v51.75,12.06 IC102.1
/RES  (via drill 0.3)
  Top 0.406: SV101.5 19.68,11.43 19.05,12.06 v19.05,44.77 | v39.37,44.77 v39.37,56.2 v39.37,68.9 | R103.1 29.84,60.33 C104.1
  Bottom 0.406: v19.05,44.77 20.32,44.77 21.59,46.04 30.16,46.04 31.43,44.77 v39.37,44.77 | v39.37,56.2 IC101.9 31.43,56.2 31.11,56.52 31.11,59.05 30.48,59.69 C104.1 | IC101.37 v39.37,68.9
AREF  (via drill 0.3)
  Top 0.406: v42.23,56.2 v42.23,78.42 | v32.7,78.42 C101.1
  Bottom 0.406: IC101.32 v42.23,56.2 | v42.23,78.42 v32.7,78.42
CAN-H  (via drill 0.3)
  Top 0.406: v12.38,7.3 v12.38,13.97 v12.38,33.97 v12.38,52.39
  Bottom 0.406: IC105.7 34.29,6.99 33.97,7.3 v12.38,7.3 | v12.38,52.39 27.3,52.39 OK101.4 | X102.8 12.32,14.03 v12.38,13.97 | X103.8 12.32,34.04 v12.38,33.97
CAN-L  (via drill 0.3)
  Top 0.406: v11.43,6.35 v11.43,15.24 v11.43,35.24 v11.43,48.26
  Bottom 0.406: IC105.6 31.75,6.03 31.43,6.35 v11.43,6.35 | v11.43,48.26 R106.2 | X102.7 7.62,14.61 8.26,15.24 v11.43,15.24 | X103.7 7.62,34.61 8.26,35.24 v11.43,35.24
GND  (via drill 0.3)
  Top 0.61: LED202.K 89.53,8.57 90.49,9.53 90.49,18.73 | 90.49,18.73 90.49,33.34 | 90.49,33.34 90.49,43.5 | 90.49,43.5 v90.49,54.61 90.49,58.42 | 90.49,58.42 90.49,68.9 | 90.49,68.9 90.49,83.5 | 90.49,83.5 90.49,93.66 | 90.49,93.66 90.49,98.11 89.85,98.74 56.83,98.74 55.88,97.79 C201.2 | LED207.K 90.49,93.66 | LED208.K 90.49,83.5 | LED205.K 90.49,68.9 | LED206.K 90.17,58.74 90.49,58.42 | LED203.K 90.17,43.81 90.49,43.5 | LED204.K 90.17,33.66 90.49,33.34 | LED201.K 90.49,18.73 | REL201.7A 67.63,73.66 66.04,72.07 v66.04,67.31 | IC202.9 v53.66,2.22 | v36.83,2.22 IC105.8 36.83,6.35 34.29,8.89 IC105.2 | IC102.4 40.64,12.06 40.32,11.75 v40.32,2.22
  Top 0.813: v63.5,3.81 v63.5,26.35 63.5,28.57 IC203.15 IC203.16 IC203.17 | v67.63,3.81 REL204.7A | REL203.7A v72.07,26.35 | IC203.10 52.07,40.96 51.44,41.59 51.44,46.04 | 51.44,46.04 51.44,48.58 | 51.44,48.58 51.44,51.12 | 51.44,51.12 51.44,53.66 | 51.44,53.66 51.44,68.9 | 51.44,68.9 51.44,82.55 50.48,83.5 C109.- | v53.66,67.31 IC201.9 51.44,68.9 | 51.44,46.04 IC203.8 | IC203.7 51.44,48.58 | IC203.6 51.44,51.12 | IC203.5 51.44,53.66 | 51.44,53.66 IC101.31 | v13.65,2.54 v13.65,10.16
  Top 1.016: v23.81,9.21 v23.81,8.57 v23.81,3.49 v23.81,2.86 v23.81,2.22 v25.08,2.22 | v23.81,9.21 v23.81,9.84 SV101.6 | v17.78,79.69 v17.78,58.1 v17.78,51.12 v17.78,49.53 v17.78,43.81 v17.78,38.42 v17.78,34.92 v17.78,29.84 v17.78,28.26 v17.78,22.23 v17.78,9.84 v17.78,9.21 v18.41,9.21 | v23.81,9.21 v23.18,9.21 | C201.2 51.31,93.34 C108.- | C108.- 48.13,93.98 44.13,93.98 43.5,93.34 R108.2 43.5,87.63 40.01,84.14 IC103.1 | C109.- 49.53,84.45 49.21,84.77 48.26,85.72 48.26,91.12 49.21,92.08 49.85,91.89 C108.-
  Bottom 0.61: REL202.7A v90.49,54.61 | v66.04,67.31 v53.66,67.31
  Bottom 0.813: v72.07,26.35 v63.5,26.35 | v63.5,3.81 v67.63,3.81 | IC203.17 57.15,35.88 56.2,36.83 56.2,40.01 55.24,40.96 IC203.10 | IC101.31 45.72,53.66 44.45,52.39 40.32,52.39 39.05,51.12 IC101.11 32.38,51.12 30.8,49.53 v17.78,49.53 | OK101.2 v17.78,51.12 | C104.2 C107.2 22.54,58.74 21.91,58.1 v17.78,58.1 | X101.9 17.72,43.76 v17.78,43.81 | X103.S@1 17.61,38.58 v17.78,38.42 | v17.78,22.23 17.63,22.38 X103.S@2 X102.S@1 | X103.5 7.62,30.16 | X103.4 7.81,29.97 7.62,30.16 | X103.3 7.62,30.16 | 7.62,30.16 9.21,30.16 9.53,29.84 v17.78,29.84 | X102.S@2 13.49,2.38 v13.65,2.54 | v13.65,10.16 9.59,10.16 X102.4 9.21,10.16 | 9.21,10.16 8.89,10.16 8.06,10.99 X102.5 | 9.21,10.16 17.46,10.16 v17.78,9.84 | IC104.9 29.21,24.77 28.26,25.72 20.32,25.72 v17.78,28.26 | C103.1 C102.1 C105.1 | C106.1 C105.1 | C105.1 v17.78,34.92
  Bottom 1.016: v63.5,3.81 57.15,3.81 55.56,2.22 v53.66,2.22 v40.32,2.22 v36.83,2.22 v25.08,2.22 v24.45,2.22 v23.81,2.22 v23.81,3.49 | v23.81,9.21 v23.18,9.21 v18.41,9.21 v17.78,9.21 v17.78,9.84 | v23.81,9.84 v23.81,8.57 | V101.GND 24.77,81.92 24.13,81.28 18.1,81.28 17.78,80.96 v17.78,79.69 D101.K 3.81,79.69 2.86,80.64 2.86,89.53 3.81,90.49 7.49,90.49 CON101.2 | C101.2 35.24,83.5 IC103.1
  pour Bottom: 15.24,24.77 15.24,88.27 23.81,96.84 51.75,96.84 51.75,78.74 31.43,78.74 31.43,24.77
K11
  Top 0.61: REL201.16A 68.58,92.71 67.94,92.08 67.94,82.23 71.12,79.06 71.12,75.88 72.07,74.93 REL201.9
  Bottom 0.61: REL201.9 73.98,74.93 75.25,73.66 97.47,73.66 98.42,74.61 98.42,91.44 97.47,92.39 X201.1
K12  (via drill 0.3)
  Top 0.61: v83.82,85.09 v83.82,87.31
  Bottom 0.61: REL201.13 v83.82,85.09 | v83.82,87.31 X201.2
K13  (via drill 0.3)
  Top 0.61: v85.09,81.6 v85.09,86.04 | REL201.15A 69.53,90.17 68.9,89.53 68.9,82.55 71.44,80.01 REL201.11
  Bottom 0.61: REL201.11 73.03,80.33 74.3,81.6 v85.09,81.6 | v85.09,86.04 90.81,86.04 92.71,84.14 92.71,83.19 93.66,82.23 X201.3
K21
  Top 0.61: REL202.16A 73.34,69.85 72.71,69.22 72.71,59.37 75.88,56.2 75.88,53.66 REL202.9
  Bottom 0.61: REL202.9 97.47,52.07 98.11,52.7 98.11,64.45 X202.1
K22
  Bottom 0.61: REL202.13 94.61,62.23 X202.2
K23  (via drill 0.3)
  Top 0.61: v84.45,57.15 v84.45,60.33 | REL202.15A 73.98,67.31 73.66,66.99 73.66,59.69 76.2,57.15 REL202.11
  Bottom 0.61: REL202.11 v84.45,57.15 | v84.45,60.33 93.34,60.33 94.93,58.74 X202.3
K31
  Top 0.61: REL203.16A 73.34,47.31 72.71,46.67 72.71,36.83 75.88,33.66 75.88,31.11 REL203.9
  Bottom 0.61: REL203.9 96.84,29.53 97.79,30.48 97.79,41.59 96.84,42.55 X203.1
K32  (via drill 0.3)
  Top 0.61: v88.9,39.69 v88.9,37.47
  Bottom 0.61: REL203.13 v88.9,39.69 | v88.9,37.47 X203.2
K33
  Top 0.61: REL203.15A 73.98,44.77 73.66,44.45 73.66,37.47 76.52,34.61 REL203.11
  Bottom 0.61: REL203.11 82.55,34.61 83.5,35.56 89.53,35.56 92.71,32.38 X203.3
K41
  Top 0.61: REL204.9 70.17,6.67 69.53,7.3 69.53,11.11 68.26,12.38 68.26,23.81 68.9,24.45 REL204.16A
  Bottom 0.61: REL204.9 83.5,6.67 86.04,4.13 96.84,4.13 97.79,5.08 97.79,16.51 96.84,17.46 X204.1
K42  (via drill 0.3)
  Top 0.61: v85.09,16.83 v85.09,22.86
  Bottom 0.61: REL204.13 v85.09,16.83 | v85.09,22.86 90.49,22.86 91.44,21.91 91.44,13.34 92.39,12.38 X204.2
K43
  Top 0.61: REL204.11 70.17,11.75 69.22,12.7 69.22,21.27 69.85,21.91 REL204.15A
  Bottom 0.61: REL204.11 86.68,11.75 87.95,10.48 91.76,10.48 X204.3
LED-G
  Bottom 0.406: R102.1 31.43,74.3 31.75,73.98 IC101.2
LED-R
  Bottom 0.406: R101.1 30.48,71.44 33.02,68.9 IC101.4
MISO  (via drill 0.3)
  Top 0.406: IC104.15 41.91,19.68 40.64,20.95 40.64,25.4 40.32,25.72 v40.32,61.28
  Bottom 0.406: SV101.1 22.54,15.24 26.35,15.24 27.62,13.97 41.91,13.97 | 41.91,13.97 46.67,13.97 46.99,13.65 IC102.2 | IC104.15 41.91,13.97 | v40.32,61.28 IC101.7
MOSI  (via drill 0.3)
  Top 0.406: v26.99,13.02 v26.99,10.16 | v41.91,10.16 IC102.5 | v39.37,10.16 IC104.14 39.37,19.68 38.1,20.95 38.1,25.4 38.42,25.72 v38.42,63.82
  Bottom 0.406: SV101.4 26.04,13.97 v26.99,13.02 | v26.99,10.16 v39.37,10.16 v41.91,10.16 | v38.42,63.82 IC101.6
N$1  (via drill 0.3)
  Top 0.406: IC105.1 36.83,12.7 35.56,13.97 v35.56,19.68 | v49.53,19.68 IC104.1
  Bottom 0.406: v35.56,19.68 v49.53,19.68
N$2  (via drill 0.3)
  Top 0.406: IC105.4 29.21,12.7 30.48,13.97 v30.48,18.73 | v46.99,18.73 IC104.2
  Bottom 0.406: v30.48,18.73 v46.99,18.73
N$3
  Top 0.406: OK101.3 28.57,50.48 29.84,49.21 R106.1
N$4  (via drill 0.3)
  Top 0.406: v13.34,16.19 v13.34,53.66 | v26.35,53.66 v26.35,56.52
  Bottom 0.406: X102.3 6.92,8.95 6.35,9.53 6.35,14.29 8.26,16.19 v13.34,16.19 | v13.34,53.66 OK101.1 v26.35,53.66 | v26.35,56.52 R109.2
N$5  (via drill 0.3)
  Top 0.61: v56.52,12.06 v56.52,48.58
  Bottom 0.61: LED202.A 87.63,6.03 85.09,8.57 72.39,8.57 67.63,13.34 64.14,13.34 62.87,12.06 v56.52,12.06 | v56.52,48.58 IC203.22
N$6
  Top 1.016: D102.C 28.57,87.95 27.3,86.68 V101.IN 28.57,82.55 46.04,82.55 C109.+
  Bottom 0.813: D102.C C110.1
N$7  (via drill 0.3)
  Top 0.61: LED201.A v87.95,13.34 | v55.56,14.61 v55.56,46.04
  Bottom 0.61: v87.95,13.34 69.53,13.34 68.26,14.61 v55.56,14.61 | v55.56,46.04 IC203.21
N$8  (via drill 0.3)
  Top 0.61: IC201.16 IC201.15 | REL201.15 v73.03,87 | v63.82,87 v63.82,84.14
  Bottom 0.61: v73.03,87 v63.82,87 | v63.82,84.14 IC201.16
N$9  (via drill 0.3)
  Top 0.406: v12.38,77.15 v12.38,71.44
  Bottom 0.406: D101.AR v12.38,77.15 | v12.38,71.44 R101.2
N$10  (via drill 0.3)
  Top 0.61: v57.47,42.23 v57.47,51.12
  Bottom 0.61: LED203.A 64.45,41.27 63.5,42.23 v57.47,42.23 | v57.47,51.12 IC203.23
N$11  (via drill 0.3)
  Top 0.61: v71.75,63.82 71.75,59.05 74.93,55.88 v74.93,50.16 | v59.37,49.85 59.37,55.88 59.69,56.2 IC203.25
  Bottom 0.61: LED205.A 87.95,64.45 87.31,63.82 v71.75,63.82 | v74.93,50.16 67.94,50.16 67.63,49.85 v59.37,49.85
N$12  (via drill 0.3)
  Top 0.61: v83.82,64.77 83.82,77.15 86.04,79.38 86.04,89.22 LED207.A
  Bottom 0.61: IC203.27 61.91,61.28 63.18,62.55 66.99,62.55 69.22,64.77 v83.82,64.77
N$13  (via drill 0.3)
  Top 0.406: v13.34,82.23 v13.34,74.3
  Bottom 0.406: D101.AG v13.34,82.23 | v13.34,74.3 R102.2
N$14
  Top 0.61: RN201.1 65.41,65.09 63.82,66.67 63.82,76.83 64.45,77.47 REL201.7
  Bottom 0.61: RN201.1 65.41,64.45 64.77,65.09 56.52,65.09 55.24,63.82 IC203.1
N$15  (via drill 0.3)
  Top 0.61: v56.52,57.47 v56.52,61.28
  Bottom 0.61: REL202.7 68.26,54.61 67.63,55.24 67.63,58.1 66.99,58.74 RN201.3 64.14,58.74 62.87,57.47 v56.52,57.47 | v56.52,61.28 IC203.2
N$16  (via drill 0.3)
  Top 0.61: RN201.5 66.99,53.66 67.63,54.29 67.63,58.1 68.26,58.74 70.8,58.74 73.98,55.56 73.98,50.16 71.75,47.94 v71.75,36.51 | v55.56,54.93 v55.56,58.74
  Bottom 0.61: v71.75,36.51 67.94,36.51 67.31,35.88 67.31,32.7 67.94,32.07 REL203.7 | RN201.5 64.77,53.66 63.5,54.93 v55.56,54.93 | v55.56,58.74 IC203.3
N$17  (via drill 0.3)
  Top 0.61: v58.42,9.53 v58.42,47.31 v58.42,56.2
  Bottom 0.61: REL204.7 64.14,9.21 63.82,9.53 v58.42,9.53 | v58.42,47.31 63.18,47.31 64.45,48.58 RN201.7 | v58.42,56.2 IC203.4
N$18  (via drill 0.3)
  Top 0.61: v67.31,52.39 v67.31,27.3 | v87.95,27.3 LED204.A
  Bottom 0.61: IC203.24 62.23,53.66 63.5,52.39 v67.31,52.39 | v67.31,27.3 v87.95,27.3
N$19
  Bottom 0.61: IC203.26 62.23,58.74 63.5,60.01 81.28,60.01 82.23,59.05 84.45,59.05 87.31,56.2 LED206.A
N$20  (via drill 0.3)
  Top 0.61: IC203.28 v61.28,66.36 | v66.99,66.36 66.99,71.75 67.63,72.39 80.96,72.39 81.28,72.71 v81.28,80.01
  Bottom 0.61: v61.28,66.36 v66.99,66.36 | v81.28,80.01 87,80.01 LED208.A
N$21  (via drill 0.3)
  Top 0.406: C102.2 22.23,43.69 Q101.2 | v30.48,44.45 30.48,46.99 32.07,48.58 IC101.12
  Bottom 0.406: Q101.2 22.67,44.26 23.81,45.4 27.94,45.4 28.89,44.45 v30.48,44.45
N$22  (via drill 0.3)
  Top 0.406: C103.2 27.62,44.01 Q101.1 | IC101.13 31.75,46.04 31.43,45.72 v31.43,43.5
  Bottom 0.406: v31.43,43.5 28.13,43.5 Q101.1
N$23
  Top 0.406: C105.2 22.23,28.38 Q102.2 22.54,27.81 22.54,26.67 23.5,25.72 31.43,25.72 31.75,25.4 IC104.8
N$24
  Top 0.406: C106.2 27.62,28.07 Q102.1 28.77,26.67 33.97,26.67 34.29,26.35 IC104.7
N$37
  Top 0.61: IC201.12 IC201.11
  Bottom 0.61: REL202.15 78.74,67.31 79.06,67.63 79.06,71.75 78.42,72.39 64.14,72.39 63.18,71.44 IC201.11
N$50  (via drill 0.3)
  Top 0.61: IC202.15 IC202.16 60.01,20.95 59.37,21.59 v59.37,44.77
  Bottom 0.61: REL203.15 77.47,43.5 77.15,43.18 66.36,43.18 64.77,44.77 v59.37,44.77
N$52  (via drill 0.3)
  Top 0.61: IC202.11 IC202.12 | v59.37,19.68 v59.37,10.79
  Bottom 0.61: REL204.15 73.03,20.32 72.39,19.68 v59.37,19.68 | v59.37,10.79 IC202.12
P00  (via drill 0.3)
  Top 0.406: IC201.1 IC201.2 56.83,86.68 57.47,86.04 v57.47,62.55 | v37.47,62.55 v37.47,43.5
  Bottom 0.406: v57.47,62.55 v37.47,62.55 | v37.47,43.5 IC101.14
P01  (via drill 0.3)
  Top 0.406: IC201.3 IC201.4 55.88,81.6 56.52,80.96 v56.52,66.36 | v36.51,65.09 v36.51,38.42
  Bottom 0.406: v56.52,66.36 52.39,66.36 51.12,65.09 v36.51,65.09 | v36.51,38.42 IC101.16
P02  (via drill 0.3)
  Top 0.406: IC201.5 IC201.6 | v55.56,76.52 v55.56,72.71 | v46.04,72.71 v46.04,33.34
  Bottom 0.406: IC201.6 v55.56,76.52 | v55.56,72.71 v46.04,72.71 | v46.04,33.34 IC101.18
P03  (via drill 0.3)
  Top 0.406: IC201.7 IC201.8 | v46.99,70.17 v46.99,28.26
  Bottom 0.406: IC201.8 52.39,70.17 v46.99,70.17 | v46.99,28.26 IC101.20
P04  (via drill 0.3)
  Top 0.406: IC202.2 IC202.1 53.66,27.62 51.75,29.53 v51.75,39.69 | v43.18,39.69 v43.18,48.58
  Bottom 0.406: v51.75,39.69 v43.18,39.69 | v43.18,48.58 IC101.29
P05  (via drill 0.3)
  Top 0.406: IC202.4 IC202.3 | v50.8,20.95 v50.8,37.15 | v39.37,37.15 v39.37,43.5
  Bottom 0.406: IC202.3 v50.8,20.95 | v50.8,37.15 v39.37,37.15 | v39.37,43.5 IC101.27
P06  (via drill 0.3)
  Top 0.406: IC202.6 IC202.5 | v43.18,17.78 v43.18,38.42
  Bottom 0.406: IC202.5 52.7,15.88 50.8,17.78 v43.18,17.78 | v43.18,38.42 IC101.25
P07  (via drill 0.3)
  Top 0.406: IC202.8 IC202.7 | v45.72,10.16 45.72,25.4 44.13,26.99 v44.13,66.36
  Bottom 0.406: IC202.7 52.07,10.79 51.44,10.16 v45.72,10.16 | v44.13,66.36 IC101.36
P20  (via drill 0.3)
  Top 0.406: v20.95,42.55 20.95,46.67 22.54,48.26 22.54,57.47 20.95,59.05 v20.95,69.85
  Bottom 0.406: IC101.15 31.75,40.96 30.16,42.55 v20.95,42.55 | v20.95,69.85 7.21,69.85 X101.1
P21  (via drill 0.3)
  Top 0.406: v26.04,36.2 26.04,46.04 25.4,46.67 v25.4,67.31
  Bottom 0.406: IC101.17 31.11,35.88 30.8,36.2 v26.04,36.2 | v25.4,67.31 6.25,67.31 X101.2
P22  (via drill 0.3)
  Top 0.406: v25.08,30.8 25.08,46.04 24.45,46.67 v24.45,64.14
  Bottom 0.406: IC101.19 v25.08,30.8 | v24.45,64.14 5.92,64.14 X101.3
P23  (via drill 0.3)
  Top 0.406: v24.13,29.53 24.13,46.04 23.5,46.67 v23.5,61.28
  Bottom 0.406: IC101.21 48.58,28.26 47.31,29.53 v24.13,29.53 | v23.5,61.28 5.32,61.28 X101.4
P24  (via drill 0.3)
  Top 0.406: v42.23,46.04 v42.23,38.42 | v10.48,37.15 v10.48,57.78
  Bottom 0.406: IC101.28 v42.23,46.04 | v42.23,38.42 38.1,38.42 36.83,37.15 31.43,37.15 29.84,38.73 21.27,38.73 19.68,37.15 v10.48,37.15 | v10.48,57.78 5.33,57.78 X101.5
P25  (via drill 0.3)
  Top 0.406: v20,41.59 v20,45.72 | v9.53,45.72 v9.53,54.29
  Bottom 0.406: IC101.26 36.83,40.96 35.56,39.69 31.75,39.69 29.84,41.59 v20,41.59 | v20,45.72 v9.53,45.72 | v9.53,54.29 5.33,54.29 X101.6
P26  (via drill 0.3)
  Top 0.406: v29.53,34.61 v29.53,46.99 | v8.57,46.99 v8.57,50.8
  Bottom 0.406: IC101.24 38.1,35.88 36.83,34.61 v29.53,34.61 | v29.53,46.99 v8.57,46.99 | v8.57,50.8 5.34,50.8 X101.7
P27  (via drill 0.3)
  Top 0.406: v7.62,47.31 v7.62,55.24 | v20,55.24 20.32,55.24 v21.59,56.52 | v35.56,62.55 v35.56,60.01 | v43.18,60.01 v43.18,63.82
  Bottom 0.406: X101.8 7.25,47.26 7.3,47.31 v7.62,47.31 | v7.62,55.24 v20,55.24 | v21.59,56.52 23.18,56.52 24.45,57.78 27.3,57.78 27.94,58.42 27.94,61.28 28.26,61.59 30.48,61.59 31.43,62.55 v35.56,62.55 | v35.56,60.01 v43.18,60.01 | v43.18,63.82 IC101.35
PLUGGED  (via drill 0.3)
  Top 0.406: CON101.3 10.65,72.88 v10.79,72.71
  Bottom 0.406: v10.79,72.71 42.86,72.71 44.13,73.98 IC101.39
S1  (via drill 0.3)
  Top 0.61: IC201.17 IC201.18 v61.28,94.61 | v73.03,94.61 REL201.16
  Bottom 0.61: v61.28,94.61 v73.03,94.61
S2  (via drill 0.3)
  Top 0.61: IC201.14 IC201.13 | v59.37,70.17 v59.37,76.52
  Bottom 0.61: REL202.16 77.47,71.12 77.15,71.44 64.77,71.44 63.5,70.17 v59.37,70.17 | v59.37,76.52 IC201.13
S3  (via drill 0.3)
  Top 0.61: IC202.17 IC202.18 | v57.47,26.04 v57.47,34.61 | v66.36,34.61 v66.36,42.23
  Bottom 0.61: IC202.18 v57.47,26.04 | v57.47,34.61 v66.36,34.61 | v66.36,42.23 79.06,42.23 79.69,42.86 79.69,46.67 79.06,47.31 REL203.16
S4
  Top 0.61: IC202.13 IC202.14
  Bottom 0.61: REL204.16 74.61,24.45 75.88,25.72 79.69,25.72 80.96,24.45 80.96,19.68 79.69,18.41 64.45,18.41 63.5,17.46 63.5,16.51 62.87,15.88 IC202.14
SCK  (via drill 0.3)
  Top 0.406: v26.04,12.7 v26.04,17.78 | v36.83,17.78 IC104.13 | IC104.13 36.83,19.68 35.56,20.95 35.56,58.42 35.24,58.74 IC101.8 | IC104.13 36.83,15.56 38.42,13.97 v38.42,6.35 | v44.45,6.35 IC102.6
  Bottom 0.406: SV101.3 22.54,12.7 v26.04,12.7 | v26.04,17.78 v36.83,17.78 | v38.42,6.35 v44.45,6.35
SCL
  Bottom 0.406: IC101.22 50.16,30.8 51.44,32.07 55.24,32.07 55.88,32.7 55.88,35.24 55.24,35.88 IC203.12
SDA
  Bottom 0.406: IC203.13 IC101.23
SPG
  Bottom 0.406: R107.2 R108.1 43.18,80.33 46.99,76.52 IC101.40
V-NETZTEIL
  Bottom 1.016: D103.A 21.91,93.34 19.05,90.49 13.66,90.49 CON101.1

### Text on the board
Bottom: MBCAN-Projekt | (c) Dr.-Ing. Th. Wiesner | 01.04.2024 | bottom | mbc91.brd
tNames: HW: 24.04.01 | CH 1 | STATUS | (c) Dr.-Ing. Th. Wiesner | MBCAN-Projekt | CH 2 | IN | CH 3 | OUT | CH 4 | mbc-91